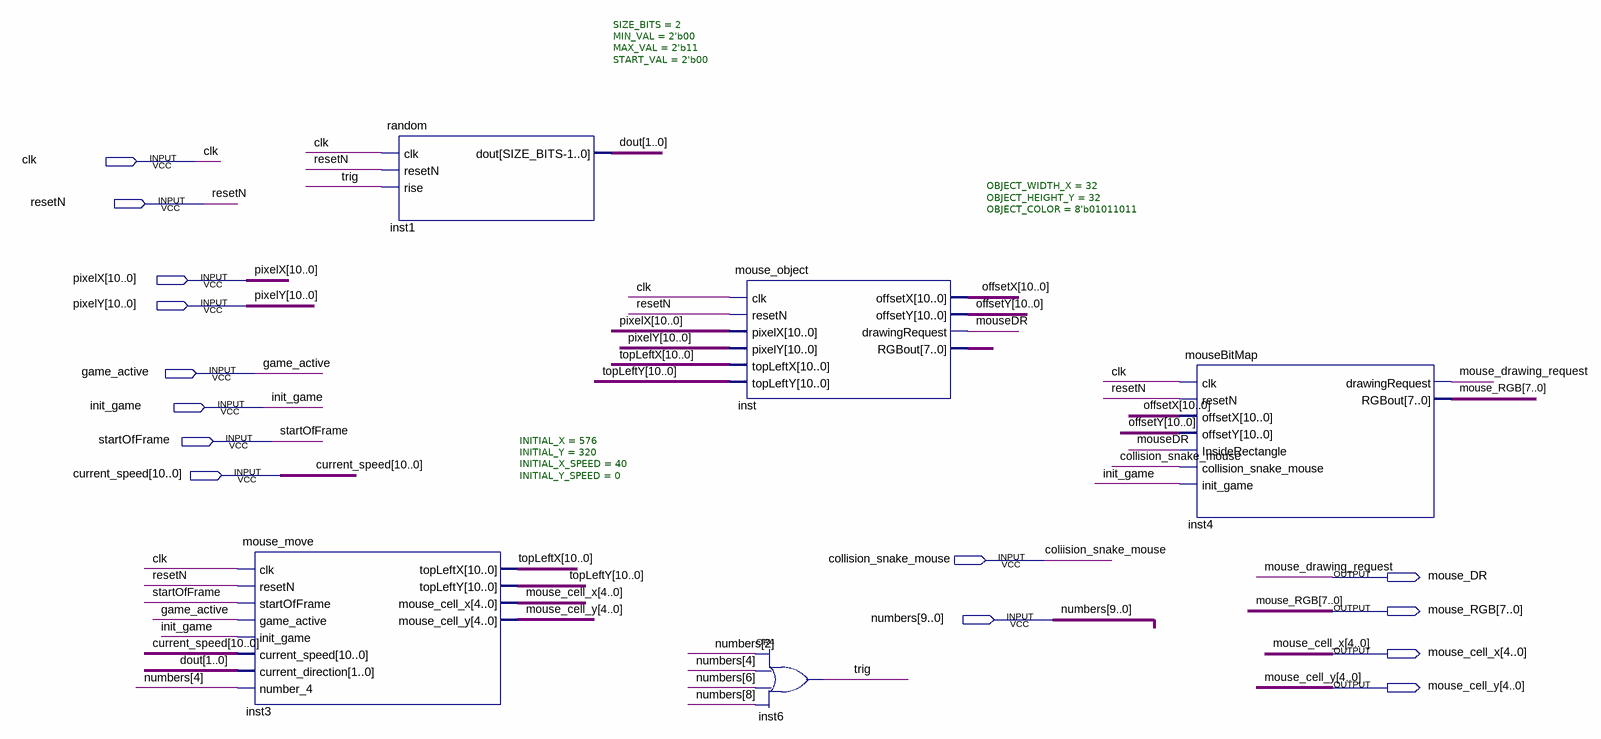
[diagram p0: schematic sheet]
// Quartus schematic mouse_display.bdf as structural Verilog: 5 symbols, 14 pins
module mouse_display (
  input  clk,
  input  resetN,
  input  [10:0] pixelX,
  input  [10:0] pixelY,
  input  game_active,
  input  init_game,
  input  startOfFrame,
  input  [10:0] current_speed,
  input  collision_snake_mouse,
  input  [9:0] numbers,
  output mouse_DR,
  output [7:0] mouse_RGB,
  output [4:0] mouse_cell_x,
  output [4:0] mouse_cell_y
);

  wire mouseDR, trig;
  wire [1:0] dout;
  wire [7:0] inst_rgbout;
  wire [10:0] offsetX, offsetY, topLeftX, topLeftY;

  mouse_move #(.INITIAL_X(576), .INITIAL_Y(320), .INITIAL_X_SPEED(40), .INITIAL_Y_SPEED(0)) inst3 (
    .clk(clk), .resetN(resetN), .startOfFrame(startOfFrame), .game_active(game_active),
    .init_game(init_game), .current_speed(current_speed), .current_direction(dout), .number_4(numbers[4]),
    .topLeftX(topLeftX), .topLeftY(topLeftY), .mouse_cell_x(mouse_cell_x), .mouse_cell_y(mouse_cell_y));
  random #(.SIZE_BITS(2), .MIN_VAL(2'b00), .MAX_VAL(2'b11), .START_VAL(2'b00)) inst1 (
    .clk(clk), .resetN(resetN), .rise(trig), .dout(dout));
  mouse_object #(.OBJECT_WIDTH_X(32), .OBJECT_HEIGHT_Y(32), .OBJECT_COLOR(8'b01011011)) inst (
    .clk(clk), .resetN(resetN), .pixelX(pixelX), .pixelY(pixelY), .topLeftX(topLeftX), .topLeftY(topLeftY),
    .offsetX(offsetX), .offsetY(offsetY), .drawingRequest(mouseDR), .RGBout(inst_rgbout));
  or inst6 (trig, numbers[2], numbers[4], numbers[6], numbers[8]);
  mouseBitMap inst4 (
    .clk(clk), .resetN(resetN), .offsetX(offsetX), .offsetY(offsetY), .InsideRectangle(mouseDR),
    .collision_snake_mouse(collision_snake_mouse), .init_game(init_game), .drawingRequest(mouse_DR),
    .RGBout(mouse_RGB));

  // Other names for the same wires on the sheet: coliision_snake_mouse = collision_snake_mouse;
  //   mouse_drawing_request = mouse_DR
endmodule
